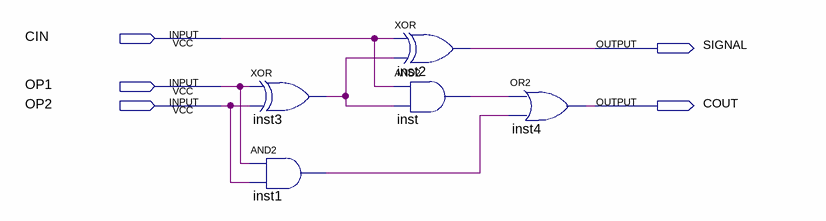
[diagram p0: schematic sheet]
// Quartus schematic add1.bdf as structural Verilog: 5 symbols, 5 pins
module add1 (
  input  CIN,
  input  OP1,
  input  OP2,
  output SIGNAL,
  output COUT
);

  wire inst1_out, inst3_out, inst_out;

  xor inst3 (inst3_out, OP1, OP2);
  and inst1 (inst1_out, OP1, OP2);
  xor inst2 (SIGNAL, CIN, inst3_out);
  and inst (inst_out, CIN, inst3_out);
  or inst4 (COUT, inst_out, inst1_out);
endmodule
